# Altium schematic sheet Connector-Sheet.SchDoc
size 420 x 297 mm; SheetNumber: 7; SheetTotal: 7
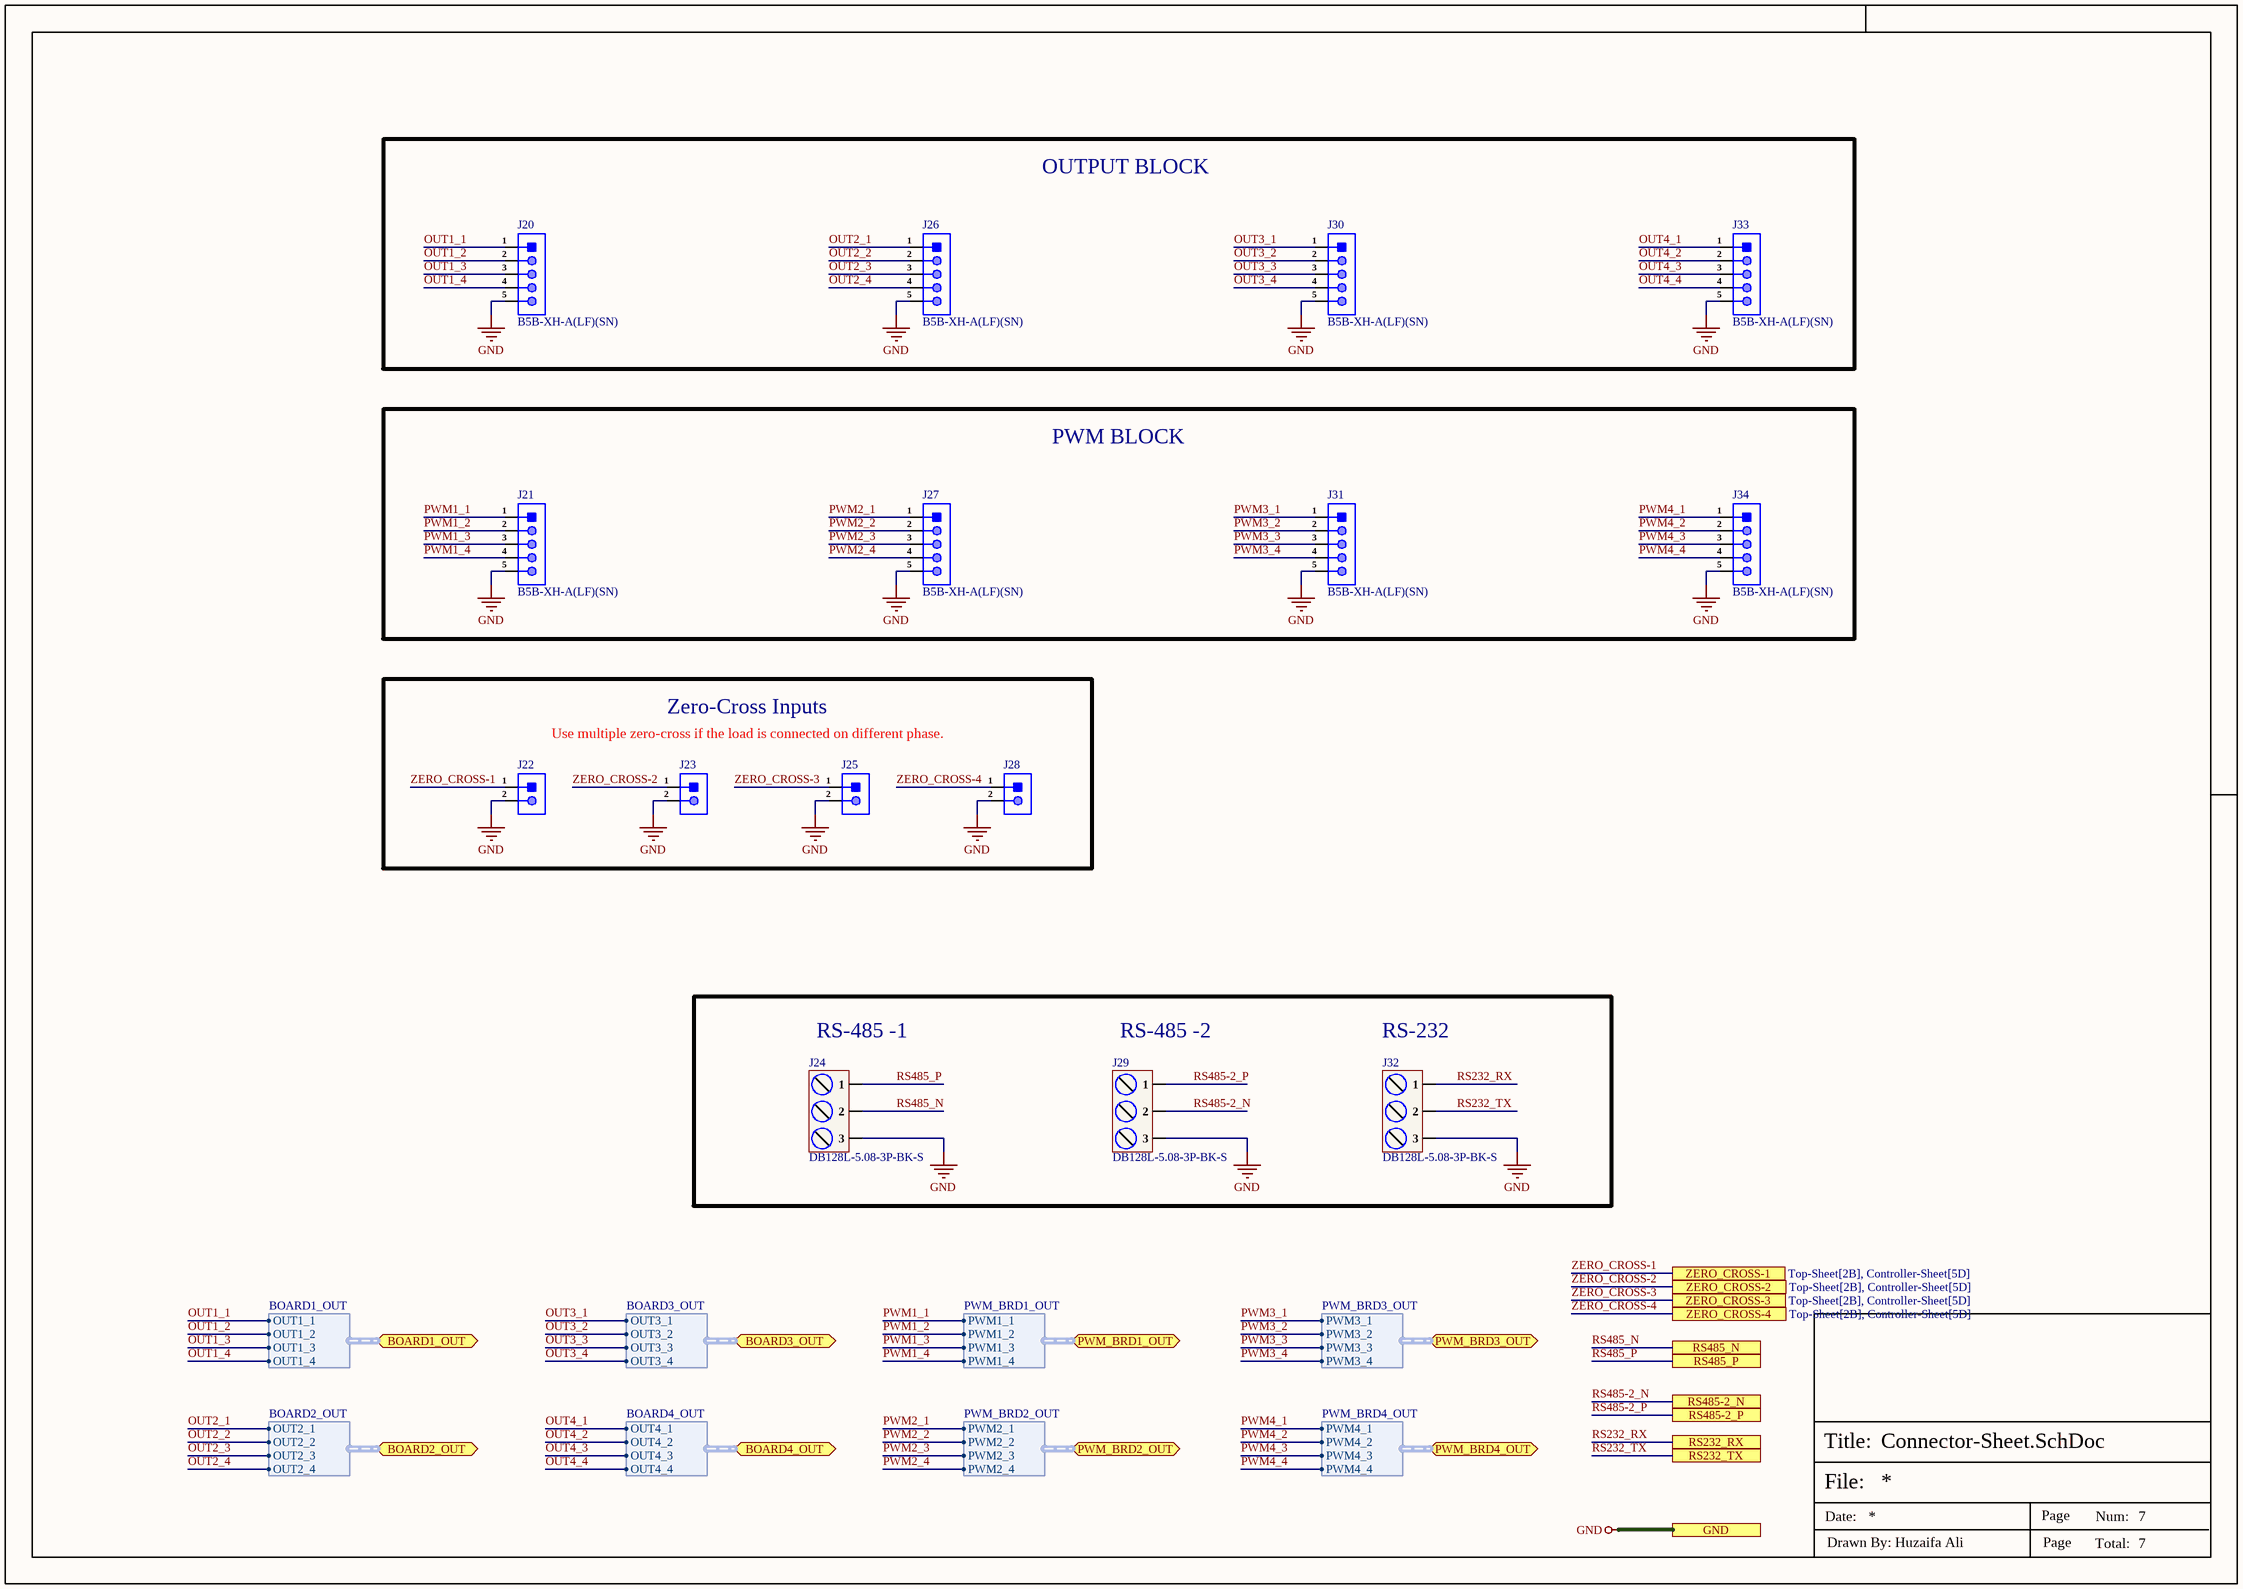
[diagram p0: Connector-Sheet.SchDoc]

## Parts
J20  B5B-XH-A(LF)(SN)  [B5B-XH-A(LF)(SN)_]
J21  B5B-XH-A(LF)(SN)  [B5B-XH-A(LF)(SN)_]
J22  B2B-XH-A(LF)(SN)  [B2B-XH-A(LF)(SN)_]  (value not drawn)
J23  B2B-XH-A(LF)(SN)  [B2B-XH-A(LF)(SN)_]  (value not drawn)
J24  DB128L-5.08-3P-BK-S  [DB128L-5.08-3P-BK-S]
J25  B2B-XH-A(LF)(SN)  [B2B-XH-A(LF)(SN)_]  (value not drawn)
J26  B5B-XH-A(LF)(SN)  [B5B-XH-A(LF)(SN)_]
J27  B5B-XH-A(LF)(SN)  [B5B-XH-A(LF)(SN)_]
J28  B2B-XH-A(LF)(SN)  [B2B-XH-A(LF)(SN)_]  (value not drawn)
J29  DB128L-5.08-3P-BK-S  [DB128L-5.08-3P-BK-S]
J30  B5B-XH-A(LF)(SN)  [B5B-XH-A(LF)(SN)_]
J31  B5B-XH-A(LF)(SN)  [B5B-XH-A(LF)(SN)_]
J32  DB128L-5.08-3P-BK-S  [DB128L-5.08-3P-BK-S]
J33  B5B-XH-A(LF)(SN)  [B5B-XH-A(LF)(SN)_]
J34  B5B-XH-A(LF)(SN)  [B5B-XH-A(LF)(SN)_]

## Blocks framed on the sheet
OUTPUT BLOCK: J20 J26 J30 J33
PWM BLOCK: J21 J27 J31 J34
Zero-Cross Inputs: J22 J23 J25 J28

## Ports
BOARD1_OUT (bidir, harness BOARD1_OUT, see Top-Sheet[2B], Controller-Sheet[1D]), BOARD2_OUT (bidir, harness BOARD2_OUT, see Top-Sheet[2B], Controller-Sheet[1D]), BOARD3_OUT (bidir, harness BOARD3_OUT, see Top-Sheet[2B], Controller-Sheet[2D]), BOARD4_OUT (bidir, harness BOARD4_OUT, see Top-Sheet[2B], Controller-Sheet[2D]), GND (see Top-Sheet[2B], CAN-Sheet[4D], Controller-Sheet[5D], EtherCAT-Sheet[5D], Power-Sheet[5D], RS485-RS232-Sheet[5D]), PWM_BRD1_OUT (bidir, harness PWM_BRD1_OUT, see Top-Sheet[2B], Controller-Sheet[1C]), PWM_BRD2_OUT (bidir, harness PWM_BRD2_OUT, see Top-Sheet[2B], Controller-Sheet[1D]), PWM_BRD3_OUT (bidir, harness PWM_BRD3_OUT, see Top-Sheet[2B], Controller-Sheet[2C]), PWM_BRD4_OUT (bidir, harness PWM_BRD4_OUT, see Top-Sheet[2B], Controller-Sheet[2D]), RS232_RX (see Top-Sheet[2B], RS485-RS232-Sheet[4D]), RS232_TX (see Top-Sheet[2B], RS485-RS232-Sheet[4D]), RS485-2_N (see Top-Sheet[2B], RS485-RS232-Sheet[4D]), RS485-2_P (see Top-Sheet[2B], RS485-RS232-Sheet[4D]), RS485_N (see Top-Sheet[2B], RS485-RS232-Sheet[4D]), RS485_P (see Top-Sheet[2B], RS485-RS232-Sheet[4D]), ZERO_CROSS-1 (see Top-Sheet[2B], Controller-Sheet[5D]), ZERO_CROSS-2 (see Top-Sheet[2B], Controller-Sheet[5D]), ZERO_CROSS-3 (see Top-Sheet[2B], Controller-Sheet[5D]), ZERO_CROSS-4 (see Top-Sheet[2B], Controller-Sheet[5D])

## Harnesses
BOARD1_OUT: OUT1_1, OUT1_2, OUT1_3, OUT1_4
BOARD2_OUT: OUT2_1, OUT2_2, OUT2_3, OUT2_4
BOARD3_OUT: OUT3_1, OUT3_2, OUT3_3, OUT3_4
BOARD4_OUT: OUT4_1, OUT4_2, OUT4_3, OUT4_4
PWM_BRD1_OUT: PWM1_1, PWM1_2, PWM1_3, PWM1_4
PWM_BRD2_OUT: PWM2_1, PWM2_2, PWM2_3, PWM2_4
PWM_BRD3_OUT: PWM3_1, PWM3_2, PWM3_3, PWM3_4
PWM_BRD4_OUT: PWM4_1, PWM4_2, PWM4_3, PWM4_4

## Nets
GND: J20.5 J21.5 J22.2 J23.2 J24.3 J25.2 J26.5 J27.5 J28.2 J29.3 J30.5 J31.5 J32.3 J33.5 J34.5 ; port GND
OUT1_1: J20.1 ; port BOARD1_OUT.OUT1_1
OUT1_2: J20.2 ; port BOARD1_OUT.OUT1_2
OUT1_3: J20.3 ; port BOARD1_OUT.OUT1_3
OUT1_4: J20.4 ; port BOARD1_OUT.OUT1_4
OUT2_1: J26.1 ; port BOARD2_OUT.OUT2_1
OUT2_2: J26.2 ; port BOARD2_OUT.OUT2_2
OUT2_3: J26.3 ; port BOARD2_OUT.OUT2_3
OUT2_4: J26.4 ; port BOARD2_OUT.OUT2_4
OUT3_1: J30.1 ; port BOARD3_OUT.OUT3_1
OUT3_2: J30.2 ; port BOARD3_OUT.OUT3_2
OUT3_3: J30.3 ; port BOARD3_OUT.OUT3_3
OUT3_4: J30.4 ; port BOARD3_OUT.OUT3_4
OUT4_1: J33.1 ; port BOARD4_OUT.OUT4_1
OUT4_2: J33.2 ; port BOARD4_OUT.OUT4_2
OUT4_3: J33.3 ; port BOARD4_OUT.OUT4_3
OUT4_4: J33.4 ; port BOARD4_OUT.OUT4_4
PWM1_1: J21.1 ; port PWM_BRD1_OUT.PWM1_1
PWM1_2: J21.2 ; port PWM_BRD1_OUT.PWM1_2
PWM1_3: J21.3 ; port PWM_BRD1_OUT.PWM1_3
PWM1_4: J21.4 ; port PWM_BRD1_OUT.PWM1_4
PWM2_1: J27.1 ; port PWM_BRD2_OUT.PWM2_1
PWM2_2: J27.2 ; port PWM_BRD2_OUT.PWM2_2
PWM2_3: J27.3 ; port PWM_BRD2_OUT.PWM2_3
PWM2_4: J27.4 ; port PWM_BRD2_OUT.PWM2_4
PWM3_1: J31.1 ; port PWM_BRD3_OUT.PWM3_1
PWM3_2: J31.2 ; port PWM_BRD3_OUT.PWM3_2
PWM3_3: J31.3 ; port PWM_BRD3_OUT.PWM3_3
PWM3_4: J31.4 ; port PWM_BRD3_OUT.PWM3_4
PWM4_1: J34.1 ; port PWM_BRD4_OUT.PWM4_1
PWM4_2: J34.2 ; port PWM_BRD4_OUT.PWM4_2
PWM4_3: J34.3 ; port PWM_BRD4_OUT.PWM4_3
PWM4_4: J34.4 ; port PWM_BRD4_OUT.PWM4_4
RS232_RX: J32.1 ; port RS232_RX
RS232_TX: J32.2 ; port RS232_TX
RS485-2_N: J29.2 ; port RS485-2_N
RS485-2_P: J29.1 ; port RS485-2_P
RS485_N: J24.2 ; port RS485_N
RS485_P: J24.1 ; port RS485_P
ZERO_CROSS-1: J22.1 ; port ZERO_CROSS-1
ZERO_CROSS-2: J23.1 ; port ZERO_CROSS-2
ZERO_CROSS-3: J25.1 ; port ZERO_CROSS-3
ZERO_CROSS-4: J28.1 ; port ZERO_CROSS-4

## Notes on the sheet
- Use multiple zero-cross if the load is connected on different phase.
- (near J24) RS-485 -1
- (near J29) RS-485 -2
- (near J32) RS-232
- File:
- Title:
- Date:
- Page
- Num:
- Total:
- Drawn By: Huzaifa Ali

## Library data of the parts
J20 J21 J26 J27 J30 J31 J33 J34 = B5B-XH-A(LF)(SN): Conn Shrouded Header HDR 5 POS 2.5mm Solder ST Thru-Hole Box; Manufacturer: JST; Current Rating: 3A; Contact Resistance: 20mR; Voltage Rating (AC): 250V; Number of Positions: 5; Insulation Resistance: 1GR; Gender: Male; Wire/Cable Gauge: 22AWG; Contact Post Length: 0.134inch; Mated Stacking Heights: 9.8mm; Item Type: JST Connector; Supplier 1: Digi-Key; Manufacturer Part Number: B5B-XH-A(LF)(SN); RoHS: Yes; Category: Headers and Wire Housings; Stock 1: 1949; Pricing 1: 1=0.25000, 10=0.23700, 100=0.16440, 500=0.13914, 1000=0.11383, 5000=0.10119, 10000=0.09170 (USD); Mount: Through Hole; Contact Material: Brass; Color: Natural; Contact Plating: Tin,Lead,Copper; Housing Color: White; Housing Material: Polyamide; Contact Shape: Square; Contact Finish - Mating: TIN; Insulation Material: Nylon; Insulation Color: Natural; Min Operating Temperature: -25°C; Max Operating Temperature: 85°C; Number of Rows: 1; Packaging: Bulk; Voltage Rating: 250V; Max Current Rating: 3A; Termination: Press-Fit; Fastening Type: Detent; Number of Contacts: 5; Max Voltage Rating (AC): 250V; Orientation: Straight; Connector Type: Header; Series: XH; Contact Type: Male Pin; Length: 14.9mm; Pitch: 2.5mm; Lead Pitch: 2.5mm; Depth: 5.75mm; Insulation Height: 0.276inch; REACH SVHC: No SVHC; Lead Free: Lead Free; Flammability Rating: UL94 V-0; ComponentLink1URL: https://datasheet.ciiva.com/26894/getdatasheetpartid-455618-26894798.pdf?src-supplier=Verical; ComponentLink1Description: https://datasheet.ciiva.com/26894/getdatasheetpartid-455618-26894798.pdf?src-supplier=Verical; ComponentLink2URL: https://datasheet.ciiva.com/11746/0900766b8082f55f-11746654.pdf?src-supplier=RSComponents; ComponentLink2Description: https://datasheet.ciiva.com/11746/0900766b8082f55f-11746654.pdf?src-supplier=RSComponents; ComponentLink3URL: https://datasheet.ciiva.com/26894/getdatasheetpartid-640991-26894479.pdf?src-supplier=Verical; ComponentLink3Description: https://datasheet.ciiva.com/26894/getdatasheetpartid-640991-26894479.pdf?src-supplier=Verical; ComponentLink4URL: https://datasheet.ciiva.com/8052/1684882-8052063.pdf?src-supplier=Element14; ComponentLink4Description: https://datasheet.ciiva.com/8052/1684882-8052063.pdf?src-supplier=Element14; ComponentLink5URL: https://datasheet.ciiva.com/20207/523653-20207174.pdf?src-supplier=Rapid+Electronics; ComponentLink5Description: https://datasheet.ciiva.com/20207/523653-20207174.pdf?src-supplier=Rapid+Electronics; ComponentLink6URL: https://datasheet.ciiva.com/724/exh-724390.pdf?src-supplier=Digi-Key; ComponentLink6Description: https://datasheet.ciiva.com/724/exh-724390.pdf?src-supplier=Digi-Key; Supplier Part Number 1: 455-2270-ND; LCSC Part Number: C157991
J22 J23 J25 J28 = B2B-XH-A(LF)(SN): Conn Shrouded Header (4 Sides) HDR 2 POS 2.5mm Solder ST Thru-Hole Box; Manufacturer: JST; Number of Positions: 2; Connector Type: Male Pin; Current Rating: 3A; Contact Resistance: 20mR; Voltage Rating: 250V; Insulation Resistance: 1GR; Wire/Cable Gauge: 22AWG; Item Type: JST Connector; Supplier 1: Farnell; Manufacturer Part Number: B2B-XH-A(LF)(SN); RoHS: Yes; Category: FFC / FPC; Stock 1: 219240; Pricing 1: 100=0.06860, 1000=0.04800, 2500=0.04520, 5000=0.04230, 10000=0.03950, 20000=0.03660 (GBP); Mount: Through Hole; Contact Plating: Tin,Copper,Lead; Color: Natural; Contact Material: Brass; Housing Color: White; Housing Material: Polyamide; Min Operating Temperature: -25°C; Max Operating Temperature: 85°C; Number of Rows: 1; Packaging: Bulk; Termination: Solder; Fastening Type: Detent; Max Current Rating: 3A; Voltage Rating (AC): 250V; Max Voltage Rating (AC): 250V; Number of Contacts: 2; Max Voltage Rating (DC): 250V; Orientation: Straight; Length: 7.4mm; Pitch: 2.5mm; Lead Pitch: 2.5mm; Depth: 5.75mm; REACH SVHC: No SVHC; Lead Free: Lead Free; ComponentLink1URL: https://datasheet.ciiva.com/26894/getdatasheetpartid-640357-26894434.pdf?src-supplier=Verical; ComponentLink1Description: https://datasheet.ciiva.com/26894/getdatasheetpartid-640357-26894434.pdf?src-supplier=Verical; ComponentLink2URL: https://datasheet.ciiva.com/11746/0900766b8082653e-11746979.pdf?src-supplier=RSComponents; ComponentLink2Description: https://datasheet.ciiva.com/11746/0900766b8082653e-11746979.pdf?src-supplier=RSComponents; ComponentLink3URL: https://datasheet.ciiva.com/26894/getdatasheetpartid-385291-26894760.pdf?src-supplier=Verical; ComponentLink3Description: https://datasheet.ciiva.com/26894/getdatasheetpartid-385291-26894760.pdf?src-supplier=Verical; ComponentLink4URL: https://datasheet.ciiva.com/8052/5448-8052024.pdf?src-supplier=Element14; ComponentLink4Description: https://datasheet.ciiva.com/8052/5448-8052024.pdf?src-supplier=Element14; ComponentLink5URL: https://datasheet.ciiva.com/20207/523653-20207167.pdf?src-supplier=Rapid+Electronics; ComponentLink5Description: https://datasheet.ciiva.com/20207/523653-20207167.pdf?src-supplier=Rapid+Electronics; Supplier Part Number 1: 1516276; LCSC Part Number: C158012
J24 J29 J32 = DB128L-5.08-3P-BK-S: 1x3P 18A -40℃~+105℃ 250V Black 12~30 Straight pin 5.08mm 2.5 1 3 Plugin,P=5.08mm Screw terminal ROHS; Manufacturer: DIBO; Item Type: Terminal Block; Manufacturer Part Number: DB128L-5.08-3P-BK-S; Package: Plugin,P=5.08mm; LCSC Part Number: C430602; ComponentLink1Description: LCSC; ComponentLink1URL: https://www.lcsc.com/product-detail/Screw-terminal_DIBO-DB128L-5-08-3P-BK-S_C430602.html